# Altium schematic sheet e-Fuse.SchDoc
size A3; SheetNumber: 4; SheetTotal: 7; SPICEModelCacheQSHFIDDY: <root> / <DocumentId>QSHFIDDY</DocumentId> / <CacheFrame Number="0"> / <Model Name="umk107b7474_a-tr" Kind="CKT"> / <Text>* UMK107B7474_A-TR     SPICE MODEL  ( General Type ) / *-------------------------------------------------------------------------------------------------------- / * Model Generated by TAIYO YUDEN Corporation (http://www.ty-top.com) / * Version 1.0 / * TAIYO YUDEN Control No. 170508_110119 / * Copyright(c) 2012 TAIYO YUDEN CO.,LTD. All Rights Reserved. / *-------------------------------------------------------------------------------------------------------- / * / * Products Name : Multilayer Ceramic Capacitors / * / * Characteristics : / *     Capacitance : 0.47 uF , Rated Voltage : 50V , TCC : X7R / *     Case Size : 1.6 x 0.8 / 0.063 x 0.031 [mm/inch] , Thickness : 0.8 / 0.031 [mm/inch] / *     (Conditions: Temperature = 25 degC , DC Bias Current/Voltage = 0A / 0V) / * / * Frequency Range : 40Hz - 3GHz / * / * External Node Assignments : / * / *  1  o---| |---o  2 / * / *-------------------------------------------------------------------------------------------------------- / .SubCkt UMK107B7474_A-TR 1 2 / **************************** / C0 1 110 0.3527u / Cm 1 101 0.045459u / C1 101 102 0.11169u / Rc1 101 102 6.9463k / C2 102 103 0.051734u / Rc2 102 103 650.62 / C3 103 110 0.038139u / Rc3 103 110 34.263 / C2m 1 301 0.059649u / C21 301 302 0.33581u / Rc21 301 302 11.28k / C22 302 303 0.20392u / Rc22 302 303 18.494k / C23 303 304 0.29488u / Rc23 303 304 12.333k / C24 304 305 0.15021u / Rc24 304 305 1.1637k / C25 305 306 0.15017u / Rc25 305 306 1.0968k / C26 306 307 0.081575u / Rc26 306 307 74.316 / C27 307 308 0.067021u / Rc27 307 308 74.754 / C28 308 309 0.05622u / Rc28 308 309 85.848 / C29 309 110 3839.3p / Rc29 309 110 14.414 / Rp0 1 110 1.06382978723404G / L0 110 120 0.25717n / Lm 120 130 0.18418n / L1 120 121 0.16238n / RL1 121 130 0.10645 / L2 120 122 1.5526n / RL2 122 130 1.0028 / L3 120 123 2.68n / RL3 123 130 1.6719 / CR 120 124 0.037577u / LR 124 125 0.31279n / RR 125 130 90.675m / CL 130 140 1.8724p / LL 130 140 0.25802n / RL 130 140 37.565 / Rs 140 2 10.204m / **************************** / .ends UMK107B7474_A-TR</Text> / </Model> / </CacheFrame> / </root>
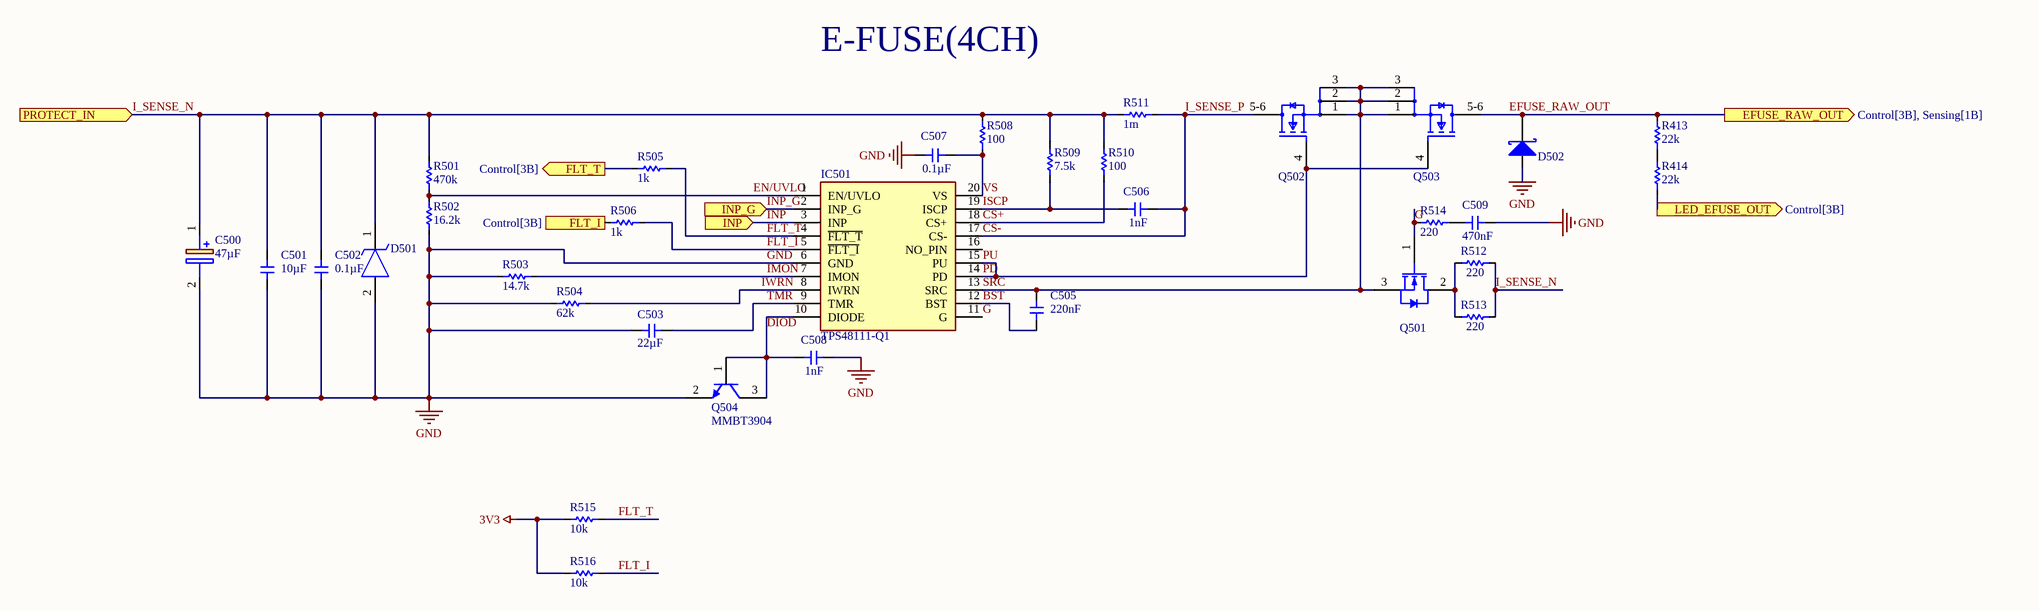
[diagram p0: e-Fuse.SchDoc]

## Parts
C500  47µF  [CAPAE1030X1050N]
C501  Capacitance: 10µF  [C1210]  (hidden comment: C_1210_10UF_10P_100V_X7R)
C502  Capacitance: 0.1µF  [C0603]  (hidden comment: C_0603_0P1UF_10P_100V_X7R)
C503  Capacitance: 22µF  [C0603]  (hidden comment: C_0603_22UF_20P_10V_X7R)
C505  Capacitance: 220nF  [C0603]  (hidden comment: C_0603_220NF_10P_25V_X7R)
C506  Capacitance: 1nF  [C0603]  (hidden comment: C_0603_1NF_10P_100V_X7R)
C507  Capacitance: 0.1µF  [C0603]  (hidden comment: C_0603_0P1UF_10P_100V_X7R)
C508  Capacitance: 1nF  [C0603]  (hidden comment: C_0603_1NF_10P_50V_X7R)
C509  Capacitance: 470nF  [C0805]  (hidden comment: C_0805_470NF_10P_100V_C0G)
D501  SMLJ58AQ-TP  [DIOM7959X282N]  (value not drawn)
D502  DFLS1100-7  [DIOD-POWERDI123-2_V]  (value not drawn)
IC501  TPS48111-Q1  [SOP50P490X110-20N]
Q501  IPD068N10N3 G  [INF-PG-TO252-3-11_A_L]  (value not drawn)
Q502  NVMFS015N10MCLT1G  [FP-488AA-MFG]  (value not drawn)
Q503  NVMFS015N10MCLT1G  [FP-488AA-MFG]  (value not drawn)
Q504  MMBT3904  [FAIR-SOT23-3_V]
R413  Resistance: 22k  [R0603]  (hidden comment: R_0603_22K_1P_0P1W)
R414  Resistance: 22k  [R0603]  (hidden comment: R_0603_22K_1P_0P1W)
R501  Resistance: 470k  [R0603]  (hidden comment: R_0603_470K_1P_0P1W)
R502  Resistance: 16.2k  [R0603]  (hidden comment: R_0603_16K2_0P1_0P1W)
R503  Resistance: 14.7k  [R0603]  (hidden comment: R_0603_14K7_0P1_0P1W)
R504  Resistance: 62k  [R0603]  (hidden comment: R_0603_66K_1P_0P1W)
R505  Resistance: 1k  [R0603]  (hidden comment: R_0603_1K_1P_0P1W)
R506  Resistance: 1k  [R0603]  (hidden comment: R_0603_1K_1P_0P1W)
R508  Resistance: 100  [R0603]  (hidden comment: R_0603_100R_1P_0P1W)
R509  Resistance: 7.5k  [R0603]  (hidden comment: R_0603_7K5_1P_0P1W)
R510  Resistance: 100  [R0603]  (hidden comment: R_0603_100R_1P_0P1W)
R511  Resistance: 1m  [R2512]  (hidden comment: R_2512_1mR_1P_3W)
R512  Resistance: 220  [R2512]  (hidden comment: R_2512_220R_1P_2W)
R513  Resistance: 220  [R2512]  (hidden comment: R_2512_220R_1P_2W)
R514  Resistance: 220  [R0603]  (hidden comment: R_0603_220R_1P_0P1W)
R515  Resistance: 10k  [R0603]  (hidden comment: R_0603_10K_1P_0P1W)
R516  Resistance: 10k  [R0603]  (hidden comment: R_0603_10K_1P_0P1W)

## Ports
EFUSE_RAW_OUT (out, see Control[3B], Sensing[1B]), FLT_I (out, see Control[3B]), FLT_T (out, see Control[3B]), INP (in, see Control[3A]), INP_G (in, see Control[3A]), LED_EFUSE_OUT (out, see Control[3B]), PROTECT_IN (in, see Control[2A])

## Nets
3V3: R515.1 R516.1
GND: C500.2(-) C501.1 C502.1 C503.1 C507.2 C508.2 C509.2 D501.2(A) D502.1(A) IC501.6(GND) Q504.2(E) R502.1 R503.1 R504.1
BST: C505.1 IC501.12(BST)
CS+: IC501.18(CS+) R510.1
CS-: C506.2 IC501.17(CS-) Q502.5-6(D) R511.2  [also labelled I_SENSE_P]
DIOD: C508.1 IC501.10(DIODE) Q504.1(B) Q504.3(C)
EFUSE_RAW_OUT: D502.2(K) Q503.5-6(D) R413.2 ; port EFUSE_RAW_OUT
EN/UVLO: IC501.1(EN/UVLO) R501.1 R502.2
FLT_I: IC501.5(~{FLT_I}) R506.2 R516.2
FLT_I: R506.1 ; port FLT_I  [a separate net that carries the same name]
FLT_T: IC501.4(~{FLT_T}) R505.2 R515.2
FLT_T: R505.1 ; port FLT_T  [a separate net that carries the same name]
G: IC501.11(G) Q501.1(GATE) R514.1
I_SENSE_N: C500.1(+) C501.2 C502.2 D501.1(K) R501.2 R508.2 R509.2 R510.2 R511.1 R512.2 R513.2 ; port PROTECT_IN
IMON: IC501.7(IMON) R503.2
INP: IC501.3(INP) ; port INP
INP_G: IC501.2(INP_G) ; port INP_G
ISCP: C506.1 IC501.19(ISCP) R509.1
IWRN: IC501.8(IWRN) R504.2
LED_EFUSE_OUT: R414.1 ; port LED_EFUSE_OUT
PD: IC501.14(PD) IC501.15(PU) Q502.4(G) Q503.4(G)  [also labelled PU]
SRC: C505.2 IC501.13(SRC) Q501.3(SOURCE) Q502.1(S) Q502.2(S) Q502.3(S) Q503.1(S) Q503.2(S) Q503.3(S)
TMR: C503.2 IC501.9(TMR)
VS: C507.1 IC501.20(VS) R508.1
NetC509_1: C509.1 R514.2
NetQ501_2: Q501.2(DRAIN) R512.1 R513.1
NetR413_1: R413.1 R414.2

Not connected (* = marked no-connect by the designer): IC501 16(NO_PIN)

## Notes on the sheet
- E-FUSE(4CH)

## Library data of the parts
C500 = UUX2A470MNL1GS: Capacitor Polarised; Manufacturer_Name: Nichicon; Datasheet Link: https://componentsearchengine.com/Datasheets/1/UUX2A470MNL1GS.pdf; Height: 10.5mm; Manufacturer_Part_Number: UUX2A470MNL1GS; Mouser Part Number: 647-UUX2A470MNL1GS; Mouser Price/Stock: https://www.mouser.co.uk/ProductDetail/Nichicon/UUX2A470MNL1GS?qs=jZZh9D7uMhmPZMofMKn2Fg%3D%3D; Arrow Part Number: UUX2A470MNL1GS; Arrow Price/Stock: https://www.arrow.com/en/products/uux2a470mnl1gs/nichicon?utm_currency=USD&region=nac
C501 = CMP-00030-3: MLCC, 10µF, 10%, 100V, X7R, 1210; Dielectric: X7S; Mounting Type: SMD; Tolerance: 10%; Package: 1210; Voltage Rating: 100V
C502 C507 = CMP-00021-3: MLCC, 0.1µF, 10%, 100V, X7R, 0603; Dielectric: X7R; Mounting Type: SMD; Tolerance: 10%; Package: 0603; Voltage Rating: 100V
C503 = CMP-00082-1: MLCC, 22µF, 20%, 10V, X5R, 0603; Tolerance: 20%; Package: 0603; Voltage Rating: 10V; Mounting Type: SMD; Dielectric: X5R
C505 = CMP-00088-1: MLCC, 220nF, 10%, 25V, X7R, 0603; Package: 0603; Voltage Rating: 25V; Dielectric: X7R; Mounting Type: SMD; Tolerance: 10%
C506 = CMP-00036-1: MLCC, 1nF, 10%, 100V, X7R, 0603; Package: 0603; Mounting Type: SMD; Dielectric: X7R; Tolerance: 10%; Voltage Rating: 100V
C508 = CMP-00046-1: MLCC, 1nF, 10%, 50V, X7R, 0603; Tolerance: 10%; Package: 0603; Dielectric: X7R; Voltage Rating: 50V; Mounting Type: SMD
C509 = CMP-00087-1: MLCC, 470nF, 10%, 100V, C0G, 0805; Dielectric: X7R; Tolerance: 10%; Mounting Type: SMD; Package: 0805; Voltage Rating: 100V
D501 = SMLJ58AQ-TP: TVS Diode (Uni-directional); Manufacturer_Name: MCC; Datasheet Link: https://www.mccsemi.com/pdf/Products/SMLJ5.0AQ_SMLJ85CAQ(SMC).pdf; Height: 2.823mm; Manufacturer_Part_Number: SMLJ58AQ-TP
D502 = CMP-2000-05099-1: 1 A High Voltage Schottky Barrier Rectifier, 0.62 V, -55 to 175 degC, 2- Pin POWERDI123, Pb-Free, Tape and Reel; Manufacturer: Diodes Inc; Average Rectified Current-Max: 1A; Peak Current-Max: 40A; Forward Voltage: 0.77V; Reverse Current-Max: 1µA; Reverse Voltage-Max [Vrrm]: 100V; Datasheet Version: Sep-14; Datasheet URL: https://datasheet.ciiva.com/15144/getdatasheetpartid-44146-15144126.pdf; Manufacturer URL: http://www.diodes.com/
IC501 = TPS48111-Q1: Integrated Circuit; Manufacturer_Name: Texas Instruments; Datasheet Link: https://www.ti.com/lit/ds/slusee5c/slusee5c.pdf; Height: 1.1mm; Manufacturer_Part_Number: TPS48111-Q1
Q501 = CMP-1091-00169-1: N-Channel OptiMOS 3 Power-Transistor, 100 V VDS, 90 A ID, -55 to 175 degC, PG-TO252-3-11, Reel, Green; Manufacturer: Infineon; QG: 51Â nC; RDS (on) (max): 6.8Â mOhm; RthJC (max): 1 K/W; VGS(th) (min): 2Â V; RthJA (max): 62 K/W; VDS (max): 100Â V; ID (max): 90Â A; Ptot (max): 150Â W; Green: TRUE; Polarity: N; VGS(th) (max): 3.5Â V; Rth: 1Â K/W; IDpuls (max): 360Â A; Packing: Reel; ComponentLink1Description: Manufacturer URL; Mounting Technology: Surface Mount; ComponentLink2Description: Datasheet; PartNumber: IPD068N10N3 G; ComponentLink2URL: http://www.infineon.com/dgdl/IPD068N10N3+G_Rev2.1.pdf?folderId=db3a304313b8b5a60113cee8763b02d7&fileId=db3a30431ce5fb52011d1eb7aeb615d1; DatasheetVersion: Rev. 2.1; ComponentLink3URL: http://www.infineon.com/dgdl/IPD160N04L_rev1.0.pdf?folderId=db3a3043163797a6011643468e7505a4&fileId=db3a3043163797a60116436401cf05cf; PackageReference: PG-TO252-3-11; PackageVersion: Rev. 02, 03/2007; ComponentLink1URL: http://www.infineon.com/; PackageDescription: 3-Pin Plastic (Green) Transistor Single Outline Package, 6.57 x 6.1 mm Body, 2.29 mm Pitch; ComponentLink3Description: Package Specification
Q502 Q503 = CMP-00278-108017151-1: NVMFS015N10MCLT1G Mosfet, N-Ch, 100V, 47.1A, Dfn Rohs Compliant: Yes; Manufacturer Lifecycle Status: ACTIVE; Lifecycle Status: Production; NexarPartId: 108017151
Q504 = CMP-1670-00008-1: NPN General Purpose Amplifier, 40 V, 0.2 A, -55 to 150 degC, 3-Pin SOT23, RoHS, Tape and Reel; Tolerance: 30ppm; Capacitance: 1.8E-11 f; Frequency: 12.288 MHz; ESR: 40 Ohm; Load Capacitance: 18 pF; REACH SVHC: No SVHC; Pins: 4; ComponentLink3URL: http://www.fairchildsemi.com/dwg/MA/MA03D.pdf; PackageDescription: 3-Pin Small Outline Transistor, Body 2.92 x 1.325 mm, Pitch 0.95 mm; ComponentLink1URL: https://www.fairchildsemi.com/; Max Operating Temperature: 70degC; PackageReference: SOT23-3; ComponentLink1Description: Manufacturer URL; Width: 0.126 inch; Min Operating Temperature: -20degC; DatasheetVersion: Rev. 1.1.0, 10/2014; Mount: Surface Mount; Height: 0.041 inch; Package Quantity: 1000; Frequency Tolerance: 30ppm; Packaging: Tape and Reel; ComponentLink2URL: https://www.fairchildsemi.com/datasheets/MM/MMBT3904.pdf; RoHSCompliant: True; ComponentLink3Description: Package Specification; ComponentLink2Description: Datasheet; Length: 0.197 inch
R413 R414 = CMP-00064-1: Chip resistor, 22k Ohm, 1%, 0.1W, 0603; Power Rating: 100mW; Voltage Rating: 75V; Tolerance: 1%; Mounting Type: SMD; Package: 0603
R501 = CMP-00071-1: Chip resistor, 470k Ohm, 1%, 0.1W, 0603; Power Rating: 100mW; Voltage Rating: 75V; Tolerance: 1%; Mounting Type: SMD; Package: 0603
R502 = CMP-00072-1: Chip resistor, 16.2k Ohm, 0.1%, 0.1W, 0603; Voltage Rating: 75V; Tolerance: 1%; Power Rating: 100mW; Package: 0603; Mounting Type: SMD
R503 = CMP-00076-1: Chip resistor, 14.7k Ohm, 0.1%, 0.1W, 0603; Voltage Rating: 75V; Power Rating: 100mW; Tolerance: 1%; Package: 0603; Mounting Type: SMD
R504 = CMP-00090-1: Chip resistor, 66k Ohm, 1%, 0.1W, 0603 / R504 -> 62k(다리, 20A), 82k(팔, 15A); Power Rating: 100mW; Voltage Rating: 75V; Mounting Type: SMD; Tolerance: 1%; Package: 0603
R505 R506 = CMP-00012-6: Chip resistor, 1k Ohm, 1%, 0.1W, 0603; Power Rating: 100mW; Voltage Rating: 50V; Mounting Type: SMD; Package: 0603; Tolerance: 1%
R508 R510 = CMP-00048-1: Chip resistor, 100 Ohm, 1%, 0.1W, 0603; Voltage Rating: 75V; Power Rating: 100mW; Tolerance: 1%; Mounting Type: SMD; Package: 0603
R509 = CMP-00079-1: Chip resistor, 7.5k Ohm, 1%, 0.1W, 0603 / R509 -> 7.5k(다리, 124A), 6.2k(팔, 104A); Voltage Rating: 75V; Power Rating: 100mW; Package: 0603; Mounting Type: SMD; Tolerance: 1%
R511 = CMP-00089-1: Chip resistor, 1m Ohm, ±1%, 3W, 2512; Mounting Type: SMD; Package: 2512; Power Rating: 3W; Tolerance: 1%
R512 R513 = CMP-00081-1: Chip resistor, 220 Ohm, ±1%, 2W, 2512; Power Rating: 2W; Tolerance: 1%; Package: 2512; Mounting Type: SMD
R514 = CMP-00080-1: Chip resistor, 220 Ohm, 1%, 0.1W, 0603; Voltage Rating: 75V; Power Rating: 100mW; Mounting Type: SMD; Tolerance: 1%; Package: 0603
R515 R516 = CMP-00032-1: Chip resistor, 10k Ohm, 1%, 0.1W, 0603; Power Rating: 100mW; Voltage Rating: 75V; Package: 0603; Mounting Type: SMD; Tolerance: 1%